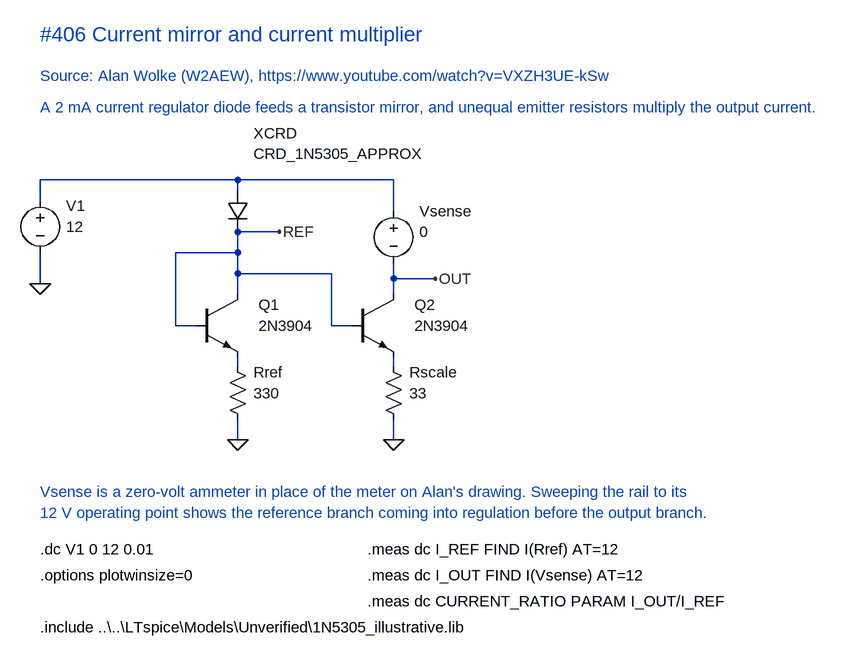
[diagram p0: schematic Current mirror multiplier.asc]
Current mirror multiplier.asc, the LTspice schematic file:
Version 4.1
SHEET 1 1300 1050
WIRE 96 272 96 304
WIRE 400 272 96 272
WIRE 640 272 400 272
WIRE 400 288 400 272
WIRE 640 320 640 272
WIRE 400 448 400 352
WIRE 464 352 400 352
WIRE 304 496 336 496
WIRE 304 384 304 496
WIRE 400 384 304 384
WIRE 576 496 544 496
WIRE 544 416 544 496
WIRE 544 416 400 416
WIRE 640 448 640 400
WIRE 704 424 640 424
WIRE 400 560 400 544
WIRE 640 560 640 544
WIRE 96 432 96 384
WIRE 400 672 400 640
WIRE 640 672 640 640
FLAG 96 432 0
FLAG 400 672 0
FLAG 640 672 0
FLAG 464 352 REF
FLAG 704 424 OUT
SYMBOL voltage 96 288 R0
WINDOW 0 40 24 Left 2
WINDOW 3 40 56 Left 2
SYMATTR InstName V1
SYMATTR Value 12
SYMBOL diode 384 288 R0
WINDOW 0 40 -88 Left 2
WINDOW 3 40 -56 Left 2
SYMATTR Prefix X
SYMATTR InstName XCRD
SYMATTR Value CRD_1N5305_APPROX
SYMBOL voltage 640 304 R0
WINDOW 0 40 16 Left 2
WINDOW 3 40 48 Left 2
SYMATTR InstName Vsense
SYMATTR Value 0
SYMBOL npn 336 448 R0
WINDOW 0 96 16 Left 2
WINDOW 3 96 48 Left 2
SYMATTR InstName Q1
SYMATTR Value 2N3904
SYMBOL npn 576 448 R0
WINDOW 0 96 16 Left 2
WINDOW 3 96 48 Left 2
SYMATTR InstName Q2
SYMATTR Value 2N3904
SYMBOL res 384 544 R0
WINDOW 0 40 24 Left 2
WINDOW 3 40 56 Left 2
SYMATTR InstName Rref
SYMATTR Value 330
SYMBOL res 624 544 R0
WINDOW 0 40 24 Left 2
WINDOW 3 40 56 Left 2
SYMATTR InstName Rscale
SYMATTR Value 33
TEXT 96 48 Left 3 ;#406 Current mirror and current multiplier
TEXT 96 112 Left 2 ;Source: Alan Wolke (W2AEW), https://www.youtube.com/watch?v=VXZH3UE-kSw
TEXT 96 160 Left 2 ;A 2 mA current regulator diode feeds a transistor mirror, and unequal emitter resistors multiply the output current.
TEXT 96 752 Left 2 ;Vsense is a zero-volt ammeter in place of the meter on Alan's drawing. Sweeping the rail to its
TEXT 96 784 Left 2 ;12 V operating point shows the reference branch coming into regulation before the output branch.
TEXT 96 840 Left 2 !.dc V1 0 12 0.01
TEXT 96 880 Left 2 !.options plotwinsize=0
TEXT 96 960 Left 2 !.include ..\..\LTspice\Models\Unverified\1N5305_illustrative.lib
TEXT 600 840 Left 2 !.meas dc I_REF FIND I(Rref) AT=12
TEXT 600 880 Left 2 !.meas dc I_OUT FIND I(Vsense) AT=12
TEXT 600 920 Left 2 !.meas dc CURRENT_RATIO PARAM I_OUT/I_REF

The netlist it stands for:
* Current mirror multiplier.asc
V1 N001 0 12
X§XCRD N001 REF CRD_1N5305_APPROX  ; pins + -
Vsense N001 OUT 0
Q1 REF REF N002 0 2N3904
Q2 OUT REF N003 0 2N3904
Rref N002 0 330
Rscale N003 0 33
.model NPN NPN
.model PNP PNP
.lib standard.bjt
* #406 Current mirror and current multiplier
* Source: Alan Wolke (W2AEW), https://www.youtube.com/watch?v=VXZH3UE-kSw
* A 2 mA current regulator diode feeds a transistor mirror, and unequal emitter resistors multiply the output current.
* Vsense is a zero-volt ammeter in place of the meter on Alan's drawing. Sweeping the rail to its
* 12 V operating point shows the reference branch coming into regulation before the output branch.
.dc V1 0 12 0.01
.options plotwinsize=0
.include ..\..\LTspice\Models\Unverified\1N5305_illustrative.lib
.meas dc I_REF FIND I(Rref) AT=12
.meas dc I_OUT FIND I(Vsense) AT=12
.meas dc CURRENT_RATIO PARAM I_OUT/I_REF
.backanno
.end